# EAGLE design WattMeter (EAGLE 9.4.2)
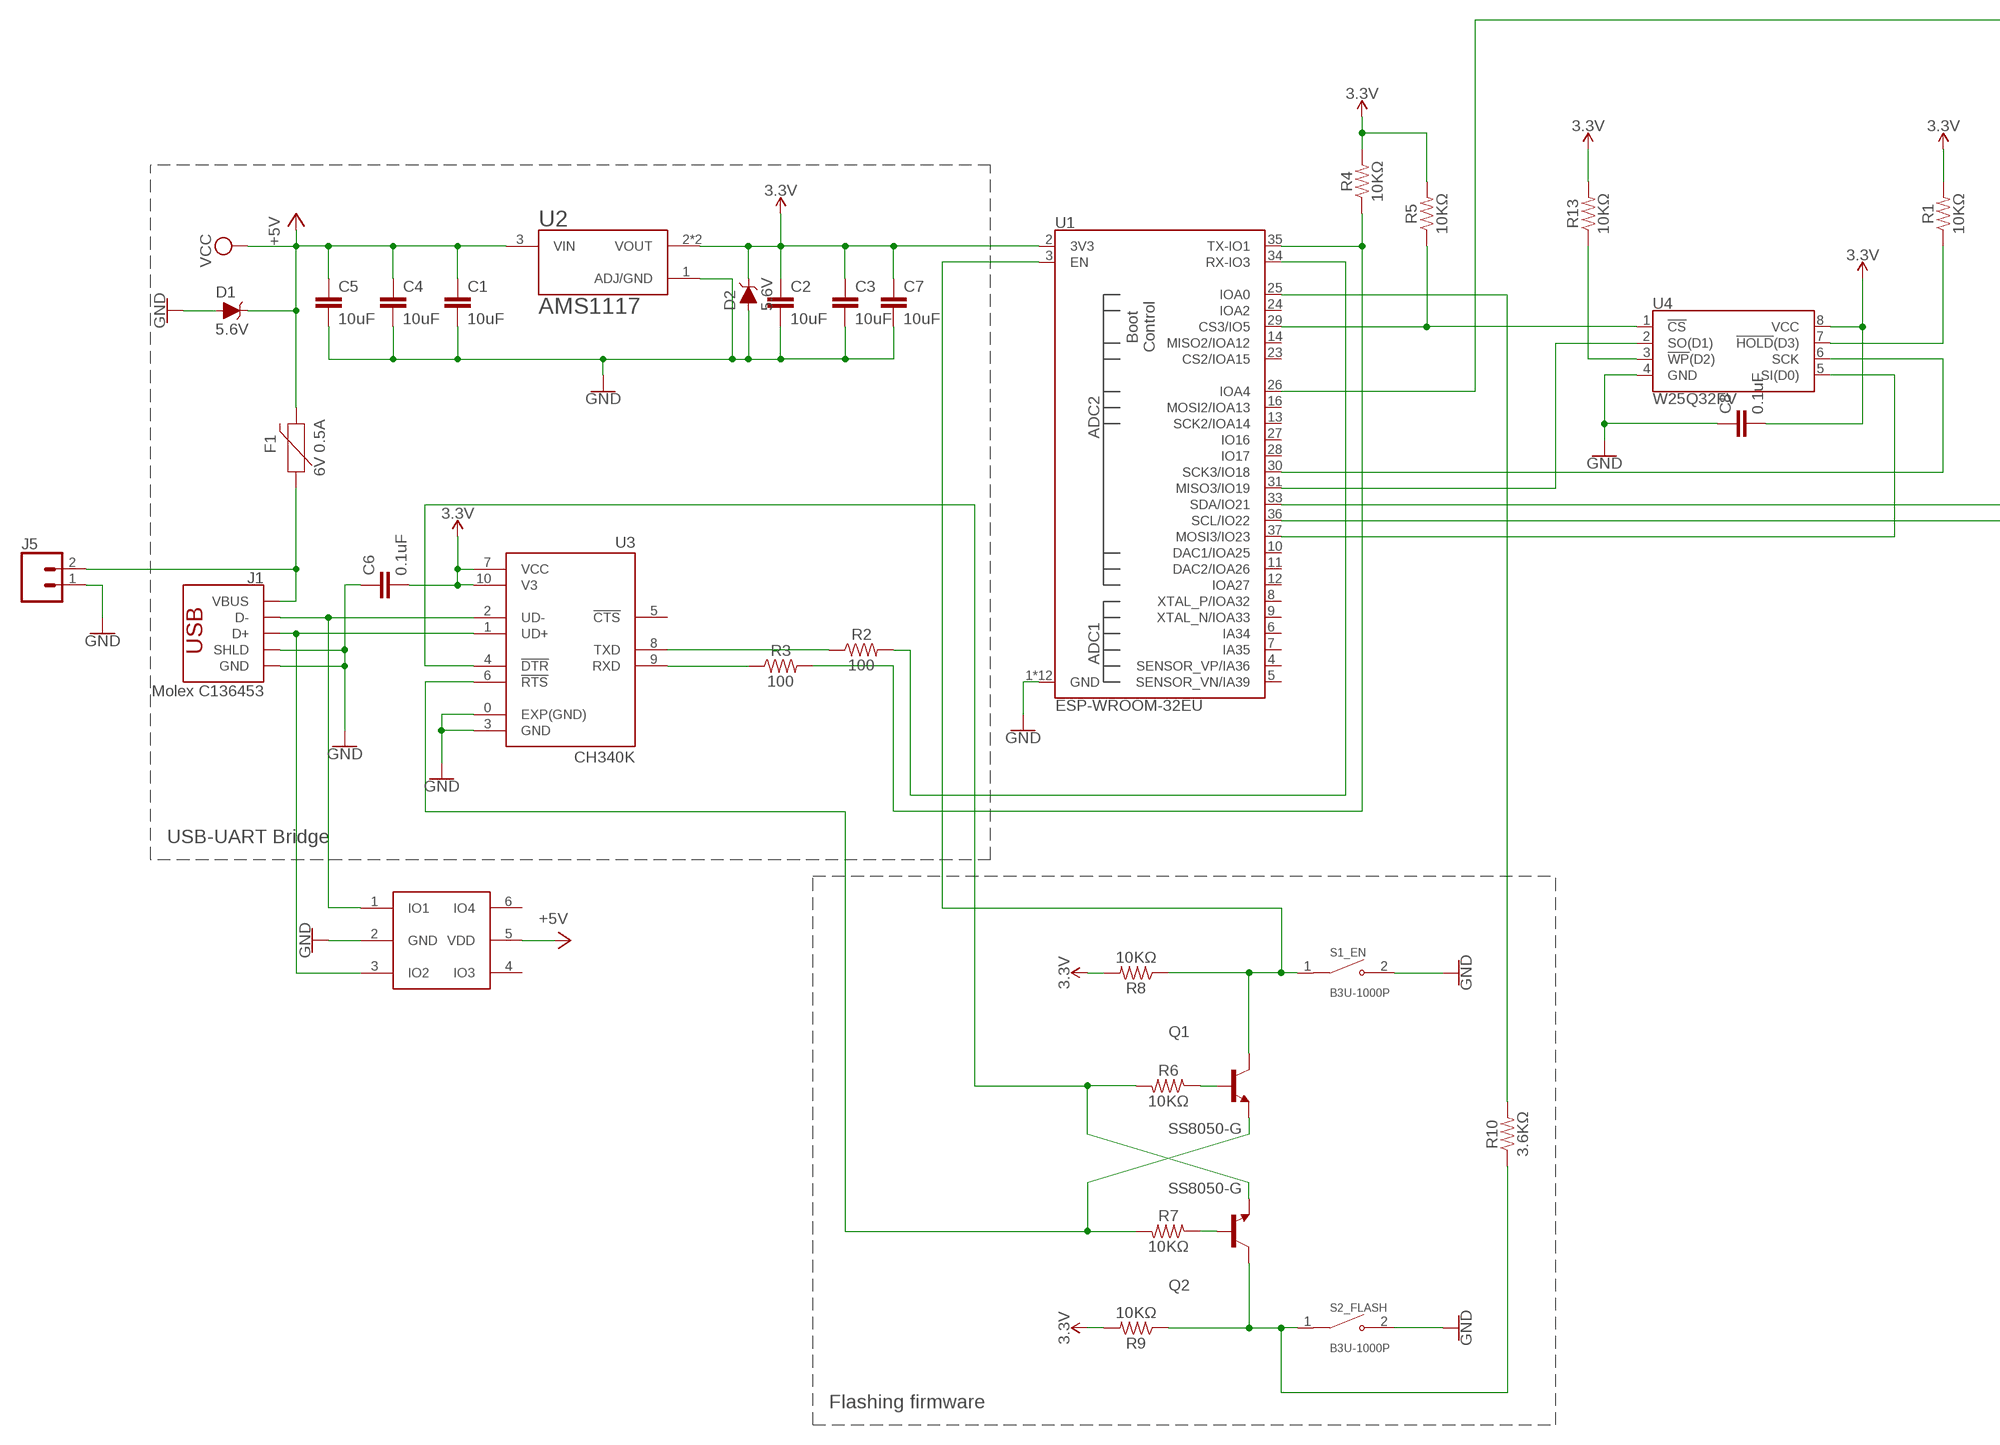
[diagram p0: schematic, sheet 1, part 1 of 2]
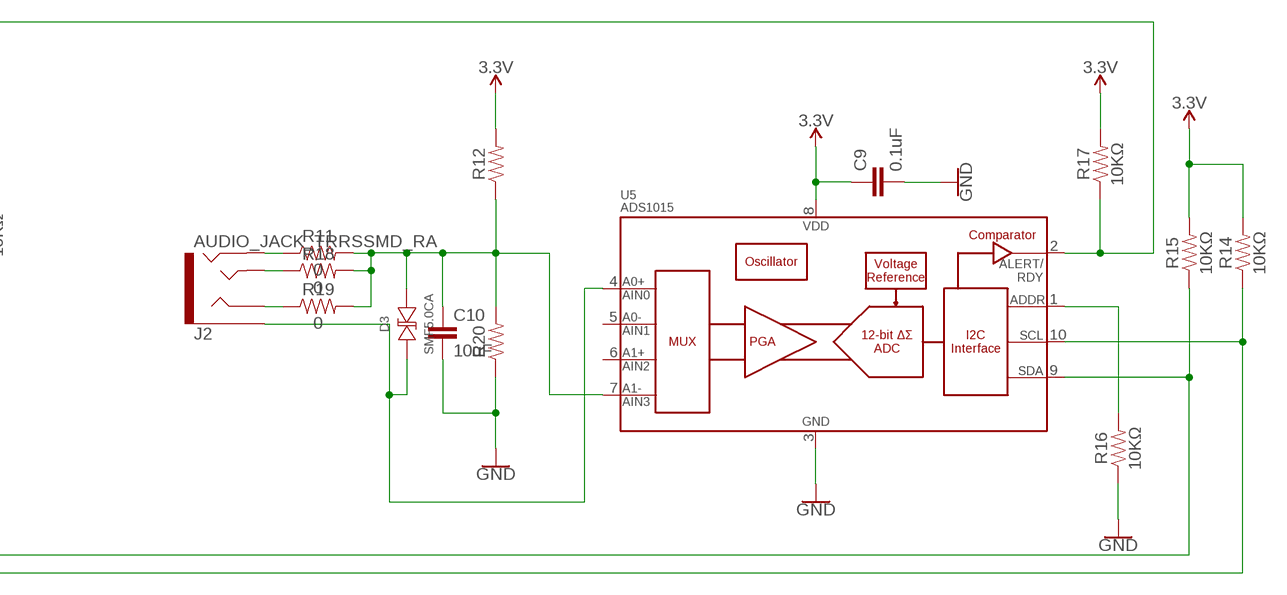
[diagram p1: schematic, sheet 1, part 2 of 2]

## Parts
C1  10uF  10UF-0603-6.3V-20%  [0603]
C2  10uF  10UF-0603-6.3V-20%  [0603]
C3  10uF  10UF-0603-6.3V-20%  [0603]
C4  10uF  10UF-0603-6.3V-20%  [0603]
C5  10uF  10UF-0603-6.3V-20%  [0603]
C6  0.1uF  0.1UF-0402-10V-10%-X7R  [0402]
C7  10uF  10UF-0603-6.3V-20%  [0603]
C8  0.1uF  0.1UF-0402-10V-10%-X7R  [0402]
C9  0.1uF  0.1UF-0402-10V-10%-X7R  [0402]
C10  10uF  10UF-0603-6.3V-20%  [0603]
D1  5.6V  DIODE-ZENER-MMSZ5232BS  [SOD-323]
D2  5.6V  DIODE-ZENER-MMSZ5232BS  [SOD-323]
D3  SMF5.0CA  [SOD-123FL]
F1  6V 0.5A  PPTC_6V500MA  [0805]
J1  Molex C136453  USB_A_SMT_MALE  [USB-A-SMT-MALE]
J2  AUDIO_JACK_TRRSSMD_RA  [AUDIO_JACK_3.5MM_TRRS_SMD_RA]
J5  CONN_023.5MM  [SCREWTERMINAL-3.5MM-2]
Q1  SS8050-G  [TRANS_SS8050-G]
Q2  SS8050-G  [TRANS_SS8050-G]
R1  10KΩ  10KOHM-0402T-1/16W-1%  [0402-TIGHT]
R2  100  100OHM-0402-TIGHT-1/16W-1%  [0402-TIGHT]
R3  100  100OHM-0402-TIGHT-1/16W-1%  [0402-TIGHT]
R4  10KΩ  10KOHM-0402T-1/16W-1%  [0402-TIGHT]
R5  10KΩ  10KOHM-0402T-1/16W-1%  [0402-TIGHT]
R6  10KΩ  10KOHM-0402T-1/16W-1%  [0402-TIGHT]
R7  10KΩ  10KOHM-0402T-1/16W-1%  [0402-TIGHT]
R8  10KΩ  10KOHM-0402T-1/16W-1%  [0402-TIGHT]
R9  10KΩ  10KOHM-0402T-1/16W-1%  [0402-TIGHT]
R10  3.6KΩ  10KOHM-0402T-1/16W-1%  [0402-TIGHT]
R11  0  0OHM-0402-1/10W  [0402]
R12  10KΩ  1KOHM-0402-1/16W-1%  [0402]
R13  10KΩ  10KOHM-0402T-1/16W-1%  [0402-TIGHT]
R14  10KΩ  10KOHM-0402T-1/16W-1%  [0402-TIGHT]
R15  10KΩ  10KOHM-0402T-1/16W-1%  [0402-TIGHT]
R16  10KΩ  10KOHM-0402T-1/16W-1%  [0402-TIGHT]
R17  10KΩ  10KOHM-0402T-1/16W-1%  [0402-TIGHT]
R18  0  0OHM-0402-1/10W  [0402]
R19  0  0OHM-0402-1/10W  [0402]
R20  10KΩ  1KOHM-0402-1/16W-1%  [0402]
S1_EN  B3U-1000P  [SW_B3U-1000P]
S2_FLASH  B3U-1000P  [SW_B3U-1000P]
U1  ESP-WROOM-32EU  [ESP-WROOM-32EU]
U2  AMS1117  [SOT229P700X180-4N]
U3  CH340K  [SOP100P600X160-11N]
U4  W25Q32FV  W25Q32FVSS  [SOIC-8]
U5  ADS1015  [MSOP10]
U6  AZC099-04S  [SOT95P275X110-6N]

## Nets
3.3V: C2.1 C3.1 C6.2 C7.1 C8.2 C9.1 D2.C R1.2 R4.2 R5.2 R8.2 R9.2 R12.2 R13.2 R14.2 R15.2 R17.2 U1.2(3V3) U2.2(VOUT) U2.4(VOUT) U3.7(VCC) U3.10(V3) U4.8(VCC) U5.8(VDD)
+5V: C1.1 C4.1 C5.1 D1.C F1.2 U2.3(VIN) U6.5(VDD) ; supply symbol labelled VCC
GND: C1.2 C2.2 C3.2 C4.2 C5.2 C6.1 C7.2 C8.1 C9.2 C10.2 D1.A D2.A J1.GND1(GND) J1.SHLD1(SHLD) J1.SHLD2(SHLD) J5.1 R16.1 R20.1 S1_EN.2 S2_FLASH.2 U1.1(GND) U1.15(GND) U1.38(GND) U1.GND U1.GNDT1(GND) U1.GNDT2(GND) U1.GNDT3(GND) U1.GNDT4(GND) U1.GNDT5(GND) U1.GNDT6(GND) U1.GNDT7(GND) U1.GNDT8(GND) U2.1(ADJ/GND) U3.0(EXP(GND)) U3.3(GND) U4.4(GND) U5.3(VSS) U6.2(GND)
N$1: J1.D-1(D-) U3.2(UD-) U6.1(IO1)
N$2: U1.31(MISO3/IO19) U4.2(SO(D1))
N$3: J1.D+1(D+) U3.1(UD+) U6.3(IO2)
N$4: Q2.1(B) R7.1
N$5: R2.1 U3.8(TXD)
N$6: Q2.2(E) R6.2 U3.4(!DTR)
N$7: Q1.2(E) R7.2 U3.6(!RTS)
N$8: R3.1 U3.9(RXD)
N$9: U1.37(MOSI3/IO23) U4.5(SI(D0))
N$10: U1.30(SCK3/IO18) U4.6(SCK)
N$11: R1.1 U4.7(!HOLD!(D3))
N$12: Q2.3(C) R9.1 R10.1 S2_FLASH.1
N$13: Q1.1(B) R6.1
N$14: R3.2 R4.1 U1.35(TX-IO1)
N$15: R2.2 U1.34(RX-IO3)
N$16: R5.1 U1.29(CS3/IO5) U4.1(!CS!)
N$17: R13.1 U4.3(!WP!(D2))
N$18: Q1.3(C) R8.1 S1_EN.1 U1.3(EN)
N$19: R10.2 U1.25(IOA0)
N$20: R15.1 U1.33(SDA/IO21) U5.9(SDA)
N$21: R14.1 U1.36(SCL/IO22) U5.10(SCL)
N$22: D3.P$1 J2.EARTH U5.4(AIN0)
N$23: R16.2 U5.1(ADDR)
N$24: R17.1 U1.26(IOA4) U5.2(ALERT/RDY)
N$25: C10.1 D3.P$2 R11.2 R12.1 R18.2 R19.2 R20.2 U5.7(AIN3)
N$26: J2.RING2 R11.1
N$27: F1.1 J1.VBUS1(VBUS) J5.2
N$28: J2.TIP R18.1
N$29: J2.RING1 R19.1
Unconnected: U1.4(SENSOR_VP/IA36) U1.5(SENSOR_VN/IA39) U1.6(IA34) U1.7(IA35) U1.8(XTAL_P/IOA32) U1.9(XTAL_N/IOA33) U1.10(DAC1/IOA25) U1.11(DAC2/IOA26) U1.12(IOA27) U1.13(SCK2/IOA14) U1.14(MISO2/IOA12) U1.16(MOSI2/IOA13) U1.23(CS2/IOA15) U1.24(IOA2) U1.27(IO16) U1.28(IO17) U3.5(!CTS) U5.5(AIN1) U5.6(AIN2) U6.4(IO3) U6.6(IO4)

## Notes on the sheet
- USB-UART Bridge
- Flashing firmware

## Library data of the parts
C1-C5 C7 C10 = SparkFun-Capacitors:10UF: 10.0µF ceramic capacitors A capacitor is a passive two-terminal electrical component used to store electrical energy temporarily in an electric field.; PCBWAY_MPN: GRM185R60J106ME15D; PROD_ID: CAP-11015
C6 C8 C9 = SparkFun-Capacitors:0.1UF: 0.1µF ceramic capacitors A capacitor is a passive two-terminal electrical component used to store electrical energy temporarily in an electric field.; PROD_ID: CAP-15083
D1 D2 = SparkFun-DiscreteSemi:DIODE-ZENER: Zener Diode A Zener diode allows current to flow from its anode to its cathode like a normal semiconductor diode, but it also permits current to flow in the reverse direction when its "Zener voltage" is reached. - WIkipedia; PROD_ID: DIO-12442
D3 = SMF5.0CA:SMF5.0CA: Check availability <https://pricing.snapeda.com/parts/SMF5.0CA/Littelfuse%20Inc./view-part?ref=eda>; AVAILABILITY: In Stock; CHECK_PRICES: https://www.snapeda.com/parts/SMF5.0CA/Littelfuse/view-part/?ref=eda; DESCRIPTION: 9.2V Clamp 21.7A Ipp Tvs Diode Surface Mount SOD-123F; MF: Littelfuse Inc.; MP: SMF5.0CA; PACKAGE: SOD-123F Littelfuse; PRICE: None; SNAPEDA_LINK: https://www.snapeda.com/parts/SMF5.0CA/Littelfuse/view-part/?ref=snap
F1 = SparkFun-Fuses:PPTC: Resettable Fuse PPTC Resettable Fuse. Really a sort of resistor with a polymeric positive temperature coefficient whose resistance increases dramatically with an increase in temperature. When heated by the power passing through the resistance rises causing the current to be limited, protecting the circuit. This is achieved by the transition of the polymer from a crystalline to an amorphous state where the conductive carbon separates breaking the conductive pathways found in the cool crystalline structure. When a PPTC cools back down it resumes conducting letting the circuit turn back on. SparkFun Products: SparkFun RedBoard - Programmed with Arduino <https://www.sparkfun.com/products/12757> Pro Micro - 5V/16MHz <https://www.sparkfun.com/products/12640> Arduino Pro 328 - 5V/16MHz <https://www.sparkfun.com/products/10915> MP3 Trigger <https://www.sparkfun.com/products/13720>; PROD_ID: RES-13945
J1 = SparkFun-Connectors:USB_A: USB-A Connector Male and female variants, as well as PTH and SMT variants SparkFun Products: SparkFun XBee Explorer Dongle <https://www.sparkfun.com/products/11697> PTH Male SparkFun MicroView-USB Programmer <https://www.sparkfun.com/products/12924> SMT Male SparkFun USB Type A Female Breakout <https://www.sparkfun.com/products/12700> SMT Female; PCBWAY_MPN: Molex C136453; PROD_ID: CONN-11499
J2 = SparkFun-Connectors:AUDIO_JACK_TRRS: Audio Jack - 3.5mm TRRS (SMD) This is a 3.5mm TRRS SMD audio jack. TRRS connectors are the audio-style connectors that you see on some phones, MP3 players and development boards. TRRS stands for “tip, ring, ring, sleeve,” which reflects that this has three conductors and a ground. SparkFun Products: Audio Jack <https://www.sparkfun.com/products/12639> mbed Starter Kit <https://www.sparkfun.com/products/12968> SparkFun TRRS 3.5mm Jack Breakout <https://www.sparkfun.com/products/11570>; PROD_ID: CONN-10676; SF_ID: PRT-12639
J5 = SparkFun-Connectors:CONN_02: Multi connection point. Often used as Generic Header-pin footprint for 0.1 inch spaced/style header connections On any of the 0.1 inch spaced packages, you can populate with these: Break Away Headers - Straight <https://www.sparkfun.com/products/116> (PRT-00116) Break Away Male Headers - Right Angle <https://www.sparkfun.com/products/553> (PRT-00553) Female Headers <https://www.sparkfun.com/products/115> (PRT-00115) Break Away Headers - Machine Pin <https://www.sparkfun.com/products/117> (PRT-00117) Break Away Female Headers - Swiss Machine Pin <https://www.sparkfun.com/products/743> (PRT-00743) For SCREWTERMINALS and SPRING TERMINALS visit here: Screw Terimnals on SparkFun.com <https://www.sparkfun.com/search/results?term=Screw+Terminals> (5mm/3.5mm/2.54mm spacing) This device is also useful as a general connection point to wire up your design to another part of your project. Our various solder wires solder well into these plated through hole pads. Hook-Up Wire - Assortment (Stranded, 22 AWG) <https://www.sparkfun.com/products/11375> (PRT-11375) Hook-Up Wire - Assortment (Solid Core, 22 AWG) <https://www.sparkfun.com/products/11367> (PRT-11367) View the entire wire category on our website here <https://www.sparkfun.com/categories/141> Special notes: Molex polarized connector foot print use with: PRT-08233 with associated crimp pins and housings. 2.54_SCREWTERM for use with PRT-10571. 3.5mm Screw Terminal footprints for PRT-08084 5mm Screw Terminal footprints for use with PRT-08432; PROD_ID: CONN-08399
Q1 Q2 = SS8050-G:SS8050-G: Bipolar (BJT) Transistor NPN 25 V 1.5 A 100MHz 300 mW Surface Mount SOT-23-3 Check availability <https://pricing.snapeda.com/parts/SS8050-G/Comchip%20Technology/view-part?ref=eda>; AVAILABILITY: In Stock; DESCRIPTION: Bipolar (BJT) Transistor NPN 25 V 1.5 A 100MHz 300 mW Surface Mount SOT-23-3; MF: Comchip Technology; MP: SS8050-G; PACKAGE: TO-236-3 Comchip Technology; PCBWAY_MPN: SS8050-G; PRICE: None; PURCHASE-URL: https://pricing.snapeda.com/search/part/SS8050-G/?ref=eda
R1 R4-R9 R13-R17 = SparkFun-Resistors:10KOHM: 10kΩ resistor A resistor is a passive two-terminal electrical component that implements electrical resistance as a circuit element. Resistors act to reduce current flow, and, at the same time, act to lower voltage levels within circuits. - Wikipedia; PCBWAY_MPN: RC0402JR-0710KL; PROD_ID: RES-14241; VALUE: 10k
R2 R3 = SparkFun-Resistors:100OHM: 100Ω resistor A resistor is a passive two-terminal electrical component that implements electrical resistance as a circuit element. Resistors act to reduce current flow, and, at the same time, act to lower voltage levels within circuits. - Wikipedia; PCBWAY_MPN: RC0402JR-071KL; PROD_ID: RES-14962
R10 = SparkFun-Resistors:10KOHM: 10kΩ resistor A resistor is a passive two-terminal electrical component that implements electrical resistance as a circuit element. Resistors act to reduce current flow, and, at the same time, act to lower voltage levels within circuits. - Wikipedia; PCBWAY_MPN: RC0402FR-073K6L; PROD_ID: RES-14241; VALUE: 10k
R11 R18 R19 = SparkFun-Resistors:0OHM: 0Ω resistor A resistor is a passive two-terminal electrical component that implements electrical resistance as a circuit element. Resistors act to reduce current flow, and, at the same time, act to lower voltage levels within circuits. - Wikipedia; PROD_ID: RES-14244
R12 R20 = SparkFun-Resistors:1KOHM: 1kΩ resistor A resistor is a passive two-terminal electrical component that implements electrical resistance as a circuit element. Resistors act to reduce current flow, and, at the same time, act to lower voltage levels within circuits. - Wikipedia; PCBWAY_MPN: RC0402JR-0710KL; PROD_ID: RES-14342
S1_EN S2_FLASH = B3U-1000P:B3U-1000P: Switch Tactile N.O. SPST Round Button Gull Wing 0.05A 12VDC 1.5N SMD Embossed T/R Check availability <https://pricing.snapeda.com/parts/B3U-1000P/Omron/view-part?ref=eda>; AVAILABILITY: In Stock; DESCRIPTION: Tactile Switch SPST-NO Top Actuated Surface Mount; MF: Omron; MP: B3U-1000P; PACKAGE: Custom Package Omron; PCBWAY_MPN: B3U-1000P; PRICE: None; PURCHASE-URL: https://pricing.snapeda.com/search/part/B3U-1000P/?ref=eda
U1 = SparkFun-RF:ESP-WROOM-32: ESP-WROOM-32D - trace antenna (includes keepout) ESP-WROOM-32U - U.FL antenna connector Includes both "standard" footprints and "narrow" version (for use with tighter layouts).; PCBWAY_MPN: ESP-WROOM-32E(4MB); PROD_ID: IC-15442
U2 = AMS1117:AMS1117: Sot223/Pkg 1-Amp 5-Volt Low Drop Out Voltage Regulatator Check availability <https://pricing.snapeda.com/parts/AMS1117/Advanced%20Monolithic%20Systems/view-part?ref=eda>; AVAILABILITY: Not in stock; DESCRIPTION: 1A LOW DROPOUT VOLTAGE REGULATOR SOT-223; MF: Advanced Monolithic Systems; MP: AMS1117; PACKAGE: SOT-223 Seeed Technology; PCBWAY_MPN: AMS1117-3.3; PRICE: None
U3 = CH340K:CH340K: Check availability <https://pricing.snapeda.com/parts/CH340K/WCH/view-part?ref=eda>; AVAILABILITY: Not in stock; CHECK_PRICES: https://www.snapeda.com/parts/CH340K/WCH/view-part/?ref=eda; DESCRIPTION: USB to Serial Port Chip; MF: WCH; MP: CH340K; PACKAGE: Package; PRICE: None; SNAPEDA_LINK: https://www.snapeda.com/parts/CH340K/WCH/view-part/?ref=snap
U4 = SparkFun-IC-Memory:W25Q32FV: W25Q32FV 32Mb (4MB) Serial Flash Memory The W25Q32FV support the standard Serial Peripheral Interface (SPI), Dual/Quad I/O SPI as well as 2-clocks instruction cycle Quad Peripheral Interface (QPI). 104MHz, SPI, 8-SOIC-EIAJ Datasheet <http://www.winbond.com/resource-files/w25q32fv%20revh%20091613.pdf> SparkFun Products SparkFun Blynk Board - ESP8266 <https://www.sparkfun.com/products/13794> (WRL-13794); PROD_ID: IC-13229
U5 = SparkFun-IC-Conversion:ADS1015: ADS1015 12-BIT ADC 12-Bit Del-Sig ADC Four single-ended inputs or two differential inputs Internal PGA I2C interface 2.0-5.5V SparkFun Products SparkFun Block for Intel Edison - ADC <https://www.sparkfun.com/products/13770> (DEV-13770); PROD_ID: IC-12270
U6 = SamacSys_Parts:AZC099-04S

## Net classes
0 default: width 0.254 mm, clearance 0.305 mm

## Board
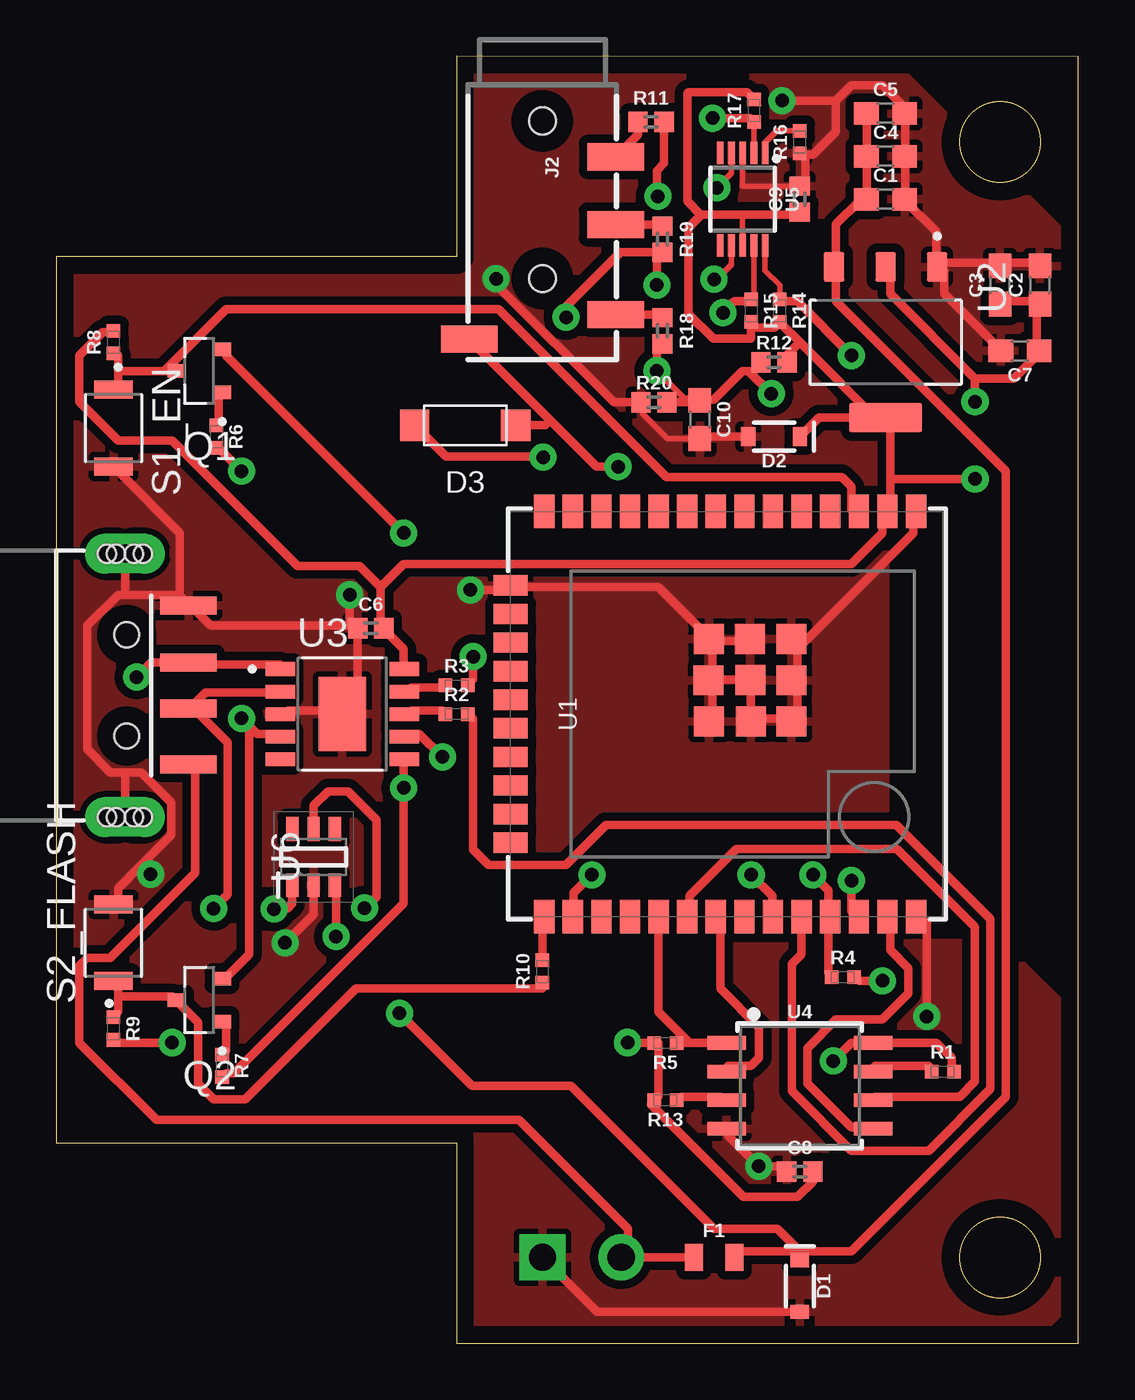
[diagram p2: board, top side]
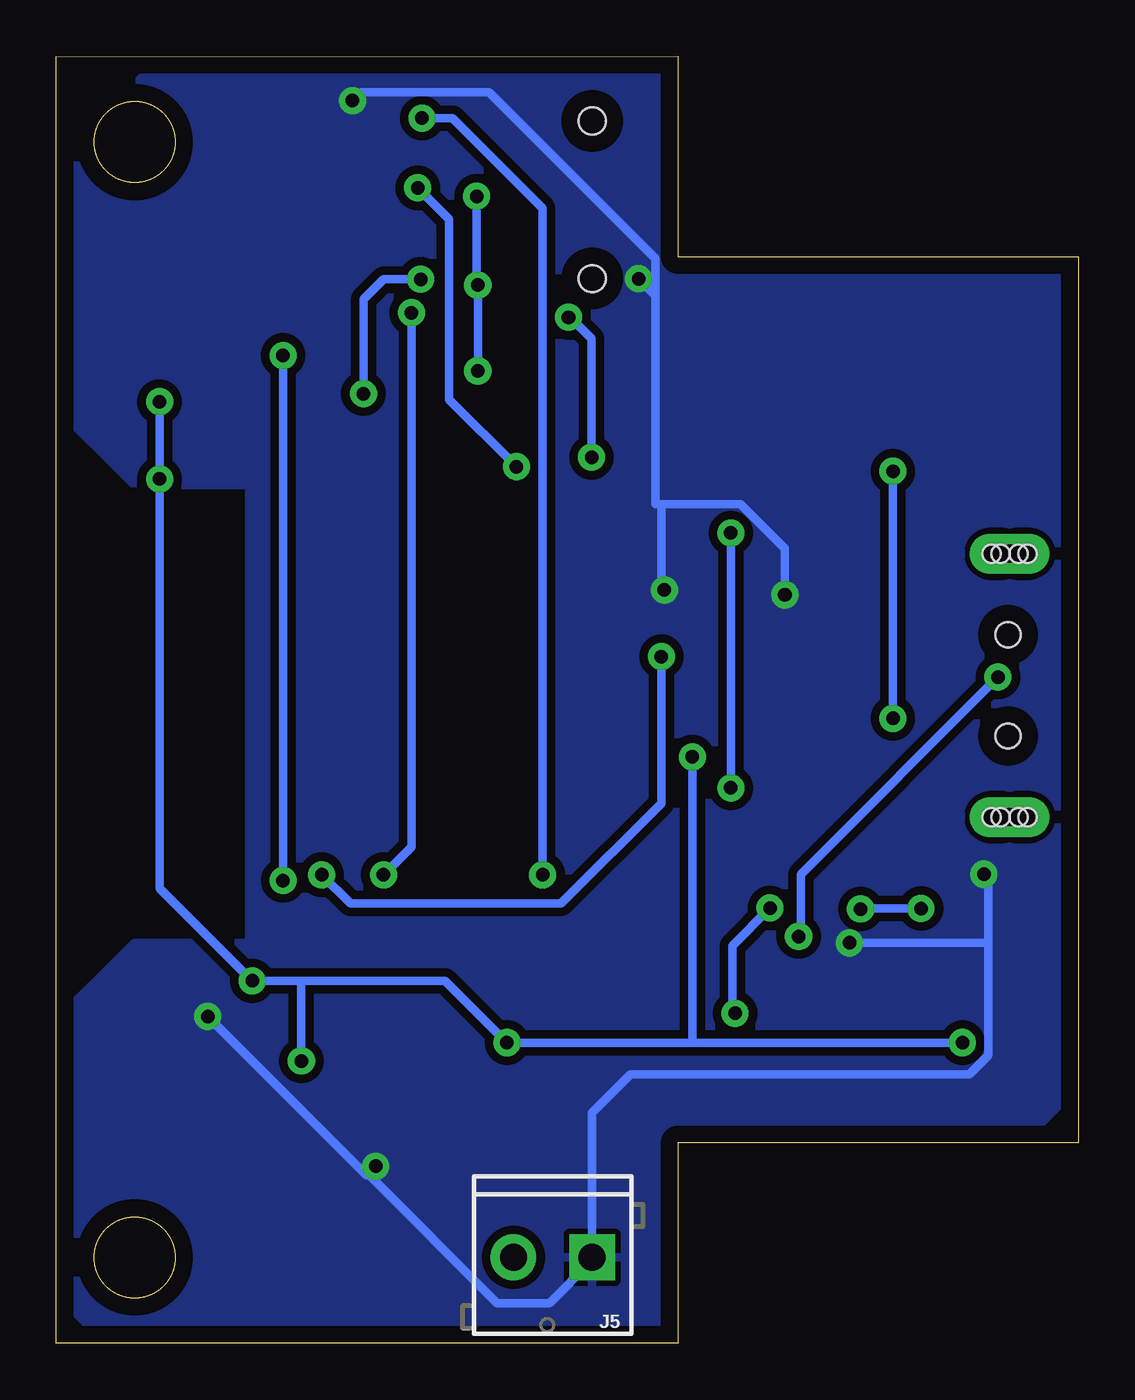
[diagram p3: board, bottom side, seen from below]

Size 45.39 x 57.15 mm. Coordinates in mm from the lower left corner, seen from the top.
Outline: 0,8.89 17.78,8.89 17.78,0 45.39,0 45.39,57.14 17.78,57.15 17.78,48.25 0,48.25 0,8.89
Outline: circle at 41.91,3.81 radius 1.8
Outline: circle at 41.91,53.34 radius 1.8
Copper layers (1*16): Top 0.035mm / dielectric 1.5mm / Bottom 0.035mm
Design rules "default *": minimum track width 6mil, minimum drill 0.6mm, track to track 6mil, track to pad 6mil, pad to pad 6mil, via to via 6mil, smd to smd 6mil, copper to edge 30mil, drill to drill 6mil, minimum pad ring 10mil, minimum via ring 8mil, stop-mask expansion 4mil, vias tented up to drill 40mil, thermal gap 10mil

### Footprints (pad centres in the part's own frame; a part is rotated, then mirrored left to right if it is on the bottom)
0603 = smd 1.1 x 1: 1 -0.85,0; 2 0.85,0
0402 = smd 0.85 x 0.9: 1 -0.58,0; 2 0.58,0
SOD-323 = smd 0.63 x 0.83: A 1.15,0; C -1.15,0
SOD-123FL = smd 1.3 x 1.4: P$1 -2.25,0; P$2 2.25,0
0805 = smd 0.8 x 1.2: 1 -0.9,0; 2 0.9,0
USB-A-SMT-MALE = smd 2.5 x 0.8: D+1 10.95,1.027; D-1 10.95,-1.027; GND1 10.95,3.551; VBUS1 10.95,-3.5 | drill 0.8 pad 1.778 long: SHLD1 8.13,-5.85; SHLD2 8.13,5.85 | hole 1.1: 8.2,2.25; 8.2,-2.25 | hole 0.8: 8.53,-5.85; 8.93,-5.85; 7.73,-5.85; 7.33,-5.85; 8.53,5.85; 8.93,5.85; 7.73,5.85; 7.33,5.85
AUDIO_JACK_3.5MM_TRRS_SMD_RA = smd 1.2 x 2.5: EARTH 11.3,-3.25; RING1 6.2,3.25; RING2 3.2,3.25; TIP 10.2,3.25 | hole 1.2: 1.6,0; 8.6,0
SCREWTERMINAL-3.5MM-2 = drill 1.2 pad 2.032 square: 1 0,0 | drill 1.2 pad 2.032: 2 3.5,0
TRANS_SS8050-G = smd 0.8 x 0.6: 1 -1.01,0.95; 2 -1.01,-0.95; 3 1.01,0
0402-TIGHT = smd 0.6 x 0.6: 1 -0.5,0; 2 0.5,0
SW_B3U-1000P = smd 0.8 x 1.7: 1 -1.7,0; 2 1.7,0
ESP-WROOM-32EU = smd 0.9 x 1.5: 1 7.7,9; 2 6.43,9; 3 5.16,9; 4 3.89,9; 5 2.62,9; 6 1.35,9; 7 0.08,9; 8 -1.19,9; 9 -2.46,9; 10 -3.73,9; 11 -5,9; 12 -6.27,9; 13 -7.54,9; 14 -8.81,9; 25 -8.81,-9; 26 -7.54,-9; 27 -6.27,-9; 28 -5,-9; 29 -3.73,-9; 30 -2.46,-9; 31 -1.19,-9; 32 0.08,-9; 33 1.35,-9; 34 2.62,-9; 35 3.89,-9; 36 5.16,-9; 37 6.43,-9; 38 7.7,-9 | smd 1.5 x 0.9: 15 -10.3,5.715; 16 -10.3,4.445; 17 -10.3,3.175; 18 -10.3,1.905; 19 -10.3,0.635; 20 -10.3,-0.635; 21 -10.3,-1.905; 22 -10.3,-3.175; 23 -10.3,-4.445; 24 -10.3,-5.715 | smd 1.33 x 1.33: GND 0.339,1.515; GNDT1 -1.5,3.33; GNDT2 -1.51,1.5; GNDT3 -1.5,-0.33; GNDT4 0.36,-0.34; GNDT5 2.16,-0.33; GNDT6 2.16,1.5; GNDT7 2.16,3.33; GNDT8 0.33,3.33
SOT229P700X180-4N = smd 1.31 x 0.93: 1 -3.345,2.29; 2 -3.345,0; 3 -3.345,-2.29 | smd 1.31 x 3.24: 4 3.345,0
SOP100P600X160-11N = smd 2.1 x 3.3: 0 0,0 | smd 1.31 x 0.6: 1 -2.75,2; 2 -2.75,1; 3 -2.75,0; 4 -2.75,-1; 5 -2.75,-2; 6 2.75,-2; 7 2.75,-1; 8 2.75,0; 9 2.75,1; 10 2.75,2
SOIC-8 = smd 0.61 x 1.702: 1 -1.905,-3.251; 2 -0.635,-3.251; 3 0.635,-3.251; 4 1.905,-3.251; 5 1.905,3.251; 6 0.635,3.251; 7 -0.635,3.251; 8 -1.905,3.251
MSOP10 = smd 0.3 x 1: 1 -1,-2.05; 2 -0.5,-2.05; 3 0,-2.05; 4 0.5,-2.05; 5 1,-2.05; 6 1,2.05; 7 0.5,2.05; 8 0,2.05; 9 -0.5,2.05; 10 -1,2.05
SOT95P275X110-6N = smd 1.05 x 0.55: 1 -1.25,0.95; 2 -1.25,0; 3 -1.25,-0.95; 4 1.25,-0.95; 5 1.25,0; 6 1.25,0.95

### Placement (x,y rotation side)
C1  36.83,50.8 0 top
C2  43.69,46.99 90 top
C3  41.91,46.99 90 top
C4  36.83,52.7 0 top
C5  36.83,54.61 0 top
C6  13.97,31.75 0 top
C7  42.8,44.07 180 top
C8  33.02,7.62 0 top
C9  33.02,50.8 90 top
C10  28.57,41.02 270 top
D1  33.02,2.54 270 top
D2  31.88,40.26 180 top
D3  18.16,40.77 180 top
F1  29.21,3.81 0 top
J1  -5.08,29.21 0 top
J2  21.59,55.88 270 top
J5  21.59,3.81 180 bottom
Q1  6.35,43.18 180 top
Q2  6.35,15.24 180 top
R1  39.37,12.07 0 top
R2  17.78,27.94 0 top
R3  17.78,29.21 0 top
R4  34.92,16.26 0 top
R5  27.05,13.34 180 top
R6  7.11,40.26 270 top
R7  7.37,12.32 270 top
R8  2.54,44.45 90 top
R9  2.54,13.97 270 top
R10  21.59,16.51 90 top
R11  26.42,54.23 0 top
R12  31.88,43.56 0 top
R13  27.05,10.79 180 top
R14  32.13,45.85 270 top
R15  30.86,45.85 270 top
R16  33.02,53.34 90 top
R17  30.99,54.74 90 top
R18  26.92,44.96 270 top
R19  26.92,49.02 270 top
R20  26.54,41.78 0 top
S1_EN  2.54,40.64 270 top
S2_FLASH  2.54,17.78 90 top
U1  30.48,27.94 0 top
U2  36.83,44.45 270 top
U3  12.7,27.94 0 top
U4  33.02,11.43 270 top
U5  30.48,50.8 180 top
U6  11.43,21.59 90 top

### Tracks (layer width: path | path; a pad name or v marks a point on that pad's centre or on a via)
3.3V  (via drill 0.6 pad 1.2)
  Top 0.254: 30.48,50.13 U5.8
  Top 0.381: R17.2 30.66,55.56 28.08,55.56 28.02,55.5 28.02,50.72 28.64,50.1 | 30.86,45.11 31.89,45.11 R14.2 32.23,45.24 33.02,44.45 | 33.02,44.45 36.69,40.78 U2.4 | 37.03,38.38 37.03,40.78 U2.4 | 37.03,38.38 37.03,37.01 U1.2 36.69,36.66 36.69,35.98 35.32,34.61 15.43,34.61 14.4,33.58 | 30.86,45.11 30.86,44.6 29.18,44.6 28.08,45.71 28.08,49.54 28.64,50.1 | 30.86,45.11 R15.2 | 14.4,33.58 13.46,34.52 10.72,34.52 5.14,40.09 2.74,40.09 1.03,41.81 1.03,43.87 2.06,44.9 2.4,44.9 R8.2 | 14.4,33.58 14.4,31.86 C6.2 14.74,31.52 15.43,30.84 15.43,30.15 U3.10 | C3.1 42.18,46.27 43.55,46.27 C2.1 43.55,45.92 43.55,44.21 C7.1 43.55,43.87 42.52,42.84 40.8,42.84 | 40.8,42.84 37.03,46.61 37.03,47.64 U2.2 | R1.2 39.78,12.32 39.78,12.66 39.09,13.35 36.35,13.35 U4.8 36.01,13.35 35.32,13.35 v34.51,12.54 | v5.14,13.35 2.74,13.35 R9.2 | v25.38,13.35 26.4,13.35 R5.2 26.75,13.35 26.75,10.95 R13.2 26.4,10.6 30.52,6.49 32.92,6.49 33.6,7.18 33.6,7.52 C8.2 | v36.69,16.09 35.66,16.09 R4.2 | v17.14,26.04 16.12,27.06 15.77,27.06 U3.7 | v40.8,41.81 40.8,42.84 | v40.8,38.38 37.03,38.38 | C9.1 32.93,50.13 30.48,50.13 28.66,50.13 28.64,50.1 | R12.2 32.4,43.83 33.02,44.45 | D2.C 33.87,41.11 U2.4
  Bottom 0.381: 17.14,13.35 v25.38,13.35 28.12,16.09 34.51,16.09 | 17.14,13.35 v5.14,13.35 | 34.51,16.09 v36.69,16.09 40.8,20.21 v40.8,38.38 v40.8,41.81 | 17.14,13.35 v17.14,26.04 | 34.51,16.09 v34.51,12.54
+5V  (via drill 0.6 pad 1.2)
  Top 0.381: C5.1 36.01,54.5 36.01,52.78 C4.1 36.01,52.44 36.01,51.07 C1.1 35.66,50.72 34.63,49.7 34.63,47.98 U2.3 34.63,47.64 34.63,46.27 42.18,38.72 42.18,10.95 35.32,4.09 33.02,4.09 | F1.2 30.39,4.09 33.02,4.09 | D1.C 33.02,4.09 | U6.5 11.43,23.88 12.06,24.51 12.95,24.51 14.22,23.24 14.22,19.81 13.74,19.33 v13.69,19.33 | v15.24,14.65 18.46,11.43 22.86,11.43 29.21,5.08 32.03,5.08 33.02,4.09
  Bottom 0.381: v13.69,19.33 15.37,17.65 15.37,14.73 15.29,14.65 v15.24,14.65
GND  (via drill 0.6 pad 1.2)
  Top 0.254: C9.2 30.48,51.38 U5.3 | C10.2 27.14,40.17 26.04,41.27 26.04,41.78
  Top 0.381: C8.1 32.23,7.86 v31.2,7.86 29.83,9.23 U4.4 | v38.66,14.5 38.66,18.71 U1.38 | C6.1 13.37,31.52 13.37,28.44 13.03,28.09 U3.0 12.69,28.09 10.29,28.09 U3.3 | 3.78,21.24 5.11,22.57 5.11,24.02 3.77,25.35 3.05,25.35 | 3.78,21.24 2.74,20.21 2.74,19.52 S2_FLASH.2 | 3.05,25.35 2.4,25.35 1.37,26.38 1.37,31.86 2.74,33.24 3.05,33.24 | 5.49,33.24 3.05,33.24 | 5.49,33.24 5.83,32.89 J1.GND1 6.17,32.55 6.86,31.86 13.03,31.86 | 5.49,33.24 5.49,35.98 2.74,38.72 S1_EN.2 | 13.03,31.86 13.37,31.86 C6.1 | C2.2 43.55,47.98 42.18,47.98 C3.2 41.83,47.98 39.43,47.98 U2.1 | C7.2 41.83,44.21 39.43,46.61 39.43,47.64 U2.1 | 33.26,52.78 33.26,51.41 C9.2 | 33.26,52.78 33.6,52.78 34.63,53.81 34.63,55.18 | 34.63,55.18 35.32,55.87 36.69,55.87 37.72,54.84 C5.2 37.72,54.5 37.72,52.78 C4.2 37.72,52.44 37.72,51.07 C1.2 37.72,50.72 39.09,49.35 39.09,47.98 U2.1 | 33.26,52.78 R16.1 | 29.15,29.46 30.52,29.46 U1.GND 30.86,29.12 30.86,27.75 | U1.GNDT3 29.15,27.75 29.15,29.12 U1.GNDT2 29.15,29.46 | 32.92,30.84 32.92,29.46 U1.GNDT6 32.92,29.12 32.92,27.75 U1.GNDT5 32.58,27.75 30.86,27.75 | 32.92,30.84 32.92,31.18 U1.GNDT7 32.92,30.84 | 32.92,30.84 38.06,35.98 38.06,36.66 U1.1 | 30.86,27.75 U1.GNDT4 | 29.15,31.18 30.52,31.18 U1.GNDT8 | v18.39,33.45 19.4,33.45 U1.15 20.23,33.58 26.75,33.58 28.8,31.52 U1.GNDT1 29.15,31.18 | 29.15,31.18 29.15,29.46 | v32.23,55.18 34.63,55.18 | v13.03,33.24 13.03,31.86 | 13.03,31.86 C6.1 | J1.SHLD2 3.05,33.24 | J1.SHLD1 3.05,25.35 | 26.04,41.78 R20.1 24.77,41.78 19.53,47.02 v19.53,47.27 | D1.A 24.01,1.39 J5.1 | C10.2 28.66,40.26 D2.A | U6.2 11.43,19.05 v10.16,17.78 | v4.19,20.83 3.78,21.24
  Bottom 0.381: 31.55,7.52 25.81,1.78 23.5,1.78 21.59,3.68 J5.1 21.59,10.24 19.89,11.94 4.84,11.94 3.99,12.79 3.99,17.78 | v38.66,14.5 31.61,7.46 31.55,7.52 | 31.55,7.52 v31.2,7.86 | 18.52,37.26 18.52,33.58 v18.39,33.45 | v32.23,55.18 31.85,55.56 26.18,55.56 18.77,48.16 18.77,46.51 | 18.77,46.51 18.77,37.26 18.52,37.26 | v13.03,33.24 13.03,35.29 15,37.26 18.52,37.26 | v19.53,47.27 18.77,46.51 | v10.16,17.78 3.99,17.78 | 3.99,17.78 3.99,20.62 v4.19,20.83
  pour Top (isolate 0.381): 0,48.26 8.89,57.15 36.83,57.15 45.72,48.26 45.72,41.91 41.91,38.1 36.83,38.1 36.83,17.78 41.91,17.78 45.72,13.97 45.72,2.54 43.18,0 13.97,0 11.43,2.54 11.43,8.89 0,8.89
  pour Bottom (isolate 0.381): 0,11.43 2.54,8.89 10.16,8.89 10.79,8.26 10.79,0 43.18,0 45.72,2.54 45.72,13.97 41.91,17.78 36.83,17.78 36.83,38.1 41.91,38.1 45.72,41.91 45.72,52.07 40.64,57.15 12.7,57.15 3.81,48.26 0,48.26
N$1  (via drill 0.6 pad 1.2)
  Top 0.381: U3.2 9.95,28.91 6.64,28.91 6.17,28.44 J1.D-1 6.11,28.18 7.62,26.67 7.62,19.94 v6.99,19.3 | v9.67,19.29 9.69,19.3 10.29,19.3 10.48,19.5 U6.1
  Bottom 0.381: v6.99,19.3 9.65,19.3 v9.67,19.29
N$2
  Top 0.381: U1.31 29.49,18.83 29.49,15.75 31.2,14.03 31.2,12.66 30.86,12.32 29.83,12.32 U4.2
N$3  (via drill 0.6 pad 1.2)
  Top 0.381: U3.1 9.94,30.15 6.17,30.15 J1.D+1 4.22,30.24 v3.56,29.58 | v12.42,18.06 12.42,20.3 U6.3
  Bottom 0.381: v12.42,18.06 12.32,18.16 12.32,20.83 v3.56,29.58
N$4
  Top 0.381: R7.1 7.54,13.01 7.54,14.03 Q2.1
N$5
  Top 0.381: R2.1 17.14,28.09 15.77,28.09 U3.8
N$6  (via drill 0.6 pad 1.2)
  Top 0.381: v8.23,38.72 7.2,39.75 R6.2 | 8.57,27.41 8.91,27.06 9.94,27.06 U3.4 | Q2.2 7.49,16.19 8.57,17.27 8.57,27.41 | 8.57,27.41 v8.23,27.75
  Bottom 0.381: v8.23,27.75 v8.23,38.72
N$7  (via drill 0.6 pad 1.2)
  Top 0.381: R7.2 7.54,11.98 7.89,11.98 15.43,19.52 v15.43,24.66 15.43,25.69 U3.6 | v15.43,35.98 7.54,43.87 Q1.2
  Bottom 0.381: v15.43,24.66 v15.43,35.98
N$8
  Top 0.381: R3.1 17.14,29.12 15.77,29.12 U3.9
N$9
  Top 0.381: U1.37 37.03,18.83 37.03,17.46 37.85,16.65 37.85,15.53 36.69,14.38 34.63,14.38 33.35,13.09 33.35,11.54 35.32,9.58 36.01,9.58 U4.5
N$10
  Top 0.381: U1.30 28.12,19.18 28.12,19.86 30.21,21.96 37.34,21.96 40.8,18.49 40.8,11.63 40.12,10.95 36.35,10.95 U4.6
N$11
  Top 0.381: R1.1 38.75,12.32 36.35,12.32 U4.7
N$12
  Top 0.381: 2.74,15.41 2.74,15.75 S2_FLASH.1 | 2.74,15.41 2.74,14.72 R9.1 | R10.1 21.6,15.75 13.32,15.75 8.39,10.82 6.99,10.82 6.3,11.51 6.3,14.25 5.49,15.06 Q2.3 5.14,15.41 2.74,15.41
N$13
  Top 0.381: R6.1 7.2,40.78 7.2,42.15 Q1.1
N$14  (via drill 0.6 pad 1.2)
  Top 0.381: R4.1 34.29,16.43 34.29,18.83 U1.35 34.29,19.18 34.29,20.12 v33.6,20.8 | v18.52,30.49 18.52,29.46 R3.2
  Bottom 0.381: v18.52,30.49 18.52,23.98 22.97,19.52 32.32,19.52 v33.6,20.8
N$15
  Top 0.381: R2.2 18.52,27.75 18.52,21.92 19.2,21.23 22.63,21.23 24.42,23.02 37.3,23.02 41.49,18.83 41.49,11.29 38.75,8.55 35.32,8.55 32.66,11.2 32.66,16.83 33.1,17.27 U1.34
N$16
  Top 0.381: 28.12,13.35 29.49,13.35 U4.1 | 28.12,13.35 27.77,13.35 R5.1 | 28.12,13.35 26.75,14.72 26.75,18.83 U1.29
N$17
  Top 0.381: R13.1 27.77,10.95 29.49,10.95 U4.3
N$18
  Top 0.381: 2.74,43.18 2.74,42.49 S1_EN.1 | 2.74,43.18 2.74,43.87 R8.1 | 2.74,43.18 4.8,43.18 | 4.8,43.18 Q1.3 | 4.8,43.18 7.54,45.92 19.63,45.92 27.1,38.46 34.9,38.46 35.32,38.04 35.32,37.01 U1.3
N$19
  Top 0.381: R10.2 21.6,17.12 21.6,18.83 U1.25
N$20  (via drill 0.6 pad 1.2)
  Top 0.254: U5.9 30.99,46.47 R15.1
  Top 0.381: v29.62,45.76 30.12,46.27 30.78,46.27 R15.1 | v30.86,20.8 31.8,19.86 31.8,18.96 U1.33
  Bottom 0.381: v29.62,45.76 29.62,22.05 v30.86,20.8
N$21  (via drill 0.6 pad 1.2)
  Top 0.254: U5.10 31.48,47.64 32.13,46.99 R14.1
  Top 0.381: v35.32,43.87 32.92,46.27 32.23,46.27 R14.1 | v35.32,20.55 35.32,19.18 U1.36
  Bottom 0.381: v35.32,20.55 v35.32,43.87
N$22  (via drill 0.6 pad 1.2)
  Top 0.254: U5.4 29.98,51.95 v29.34,51.31
  Top 0.381: v24.96,38.93 23.99,38.93 21.93,40.98 | 21.93,40.98 J2.EARTH | D3.P$1 21.72,40.77 21.93,40.98
  Bottom 0.381: v29.34,51.31 27.94,49.91 27.94,41.91 v24.96,38.93
N$23
  Top 0.254: U5.1 31.48,53.32 32,53.84 R16.2
N$24  (via drill 0.6 pad 1.2)
  Top 0.254: U5.2 R17.1
  Top 0.381: R17.1 30.82,54.41 v29.15,54.41 | v23.79,20.8 22.97,19.99 22.97,19.18 U1.26
  Bottom 0.381: v29.15,54.41 27.79,54.41 23.79,50.41 v23.79,20.8
N$25  (via drill 0.6 pad 1.2)
  Top 0.254: U5.7 29.98,47.89 29.34,47.24 v29.21,47.24 | 30.73,43.18 30.48,43.18 | v26.67,43.18 27.94,41.91 27.98,41.87 | 27.98,41.87 28.07,41.78 | C10.1 27.98,41.87
  Top 0.381: R12.1 30.98,43.18 30.48,43.18 29.21,41.91 27.94,41.91 | R20.2 28.07,41.78 | v31.75,42.16 30.73,43.18 | R11.2 27,52.4 26.67,52.07 26.67,50.98 v26.72,50.93 | v26.67,46.99 26.67,48.19 R19.2 25.05,48.44 22.64,46.03 v22.64,45.56 | v26.67,43.18 26.67,44.12 R18.2 | D3.P$2 17.31,39.37 21.59,39.37 v21.62,39.34
  Bottom 0.381: v29.21,47.24 30.86,47.24 31.75,46.36 v31.75,42.16 | v26.72,50.93 26.72,47.04 v26.67,46.99 v26.67,43.18 | v21.62,39.34 21.62,44.6 22.61,45.59 v22.64,45.56
N$26
  Top 0.381: R11.1 25.84,53.68 J2.RING2
N$27
  Top 0.381: J1.VBUS1 6.17,25.69 6.17,20.89 2.4,17.12 1.37,17.12 1.03,16.78 1.03,13.35 4.46,9.92 20.56,9.92 25.4,5.08 25.4,3.81 | J5.2 25.4,3.81 | 25.4,3.81 F1.1
N$28
  Top 0.381: J2.TIP 26.78,45.68 R18.1
N$29
  Top 0.381: J2.RING1 26.85,49.68 R19.1